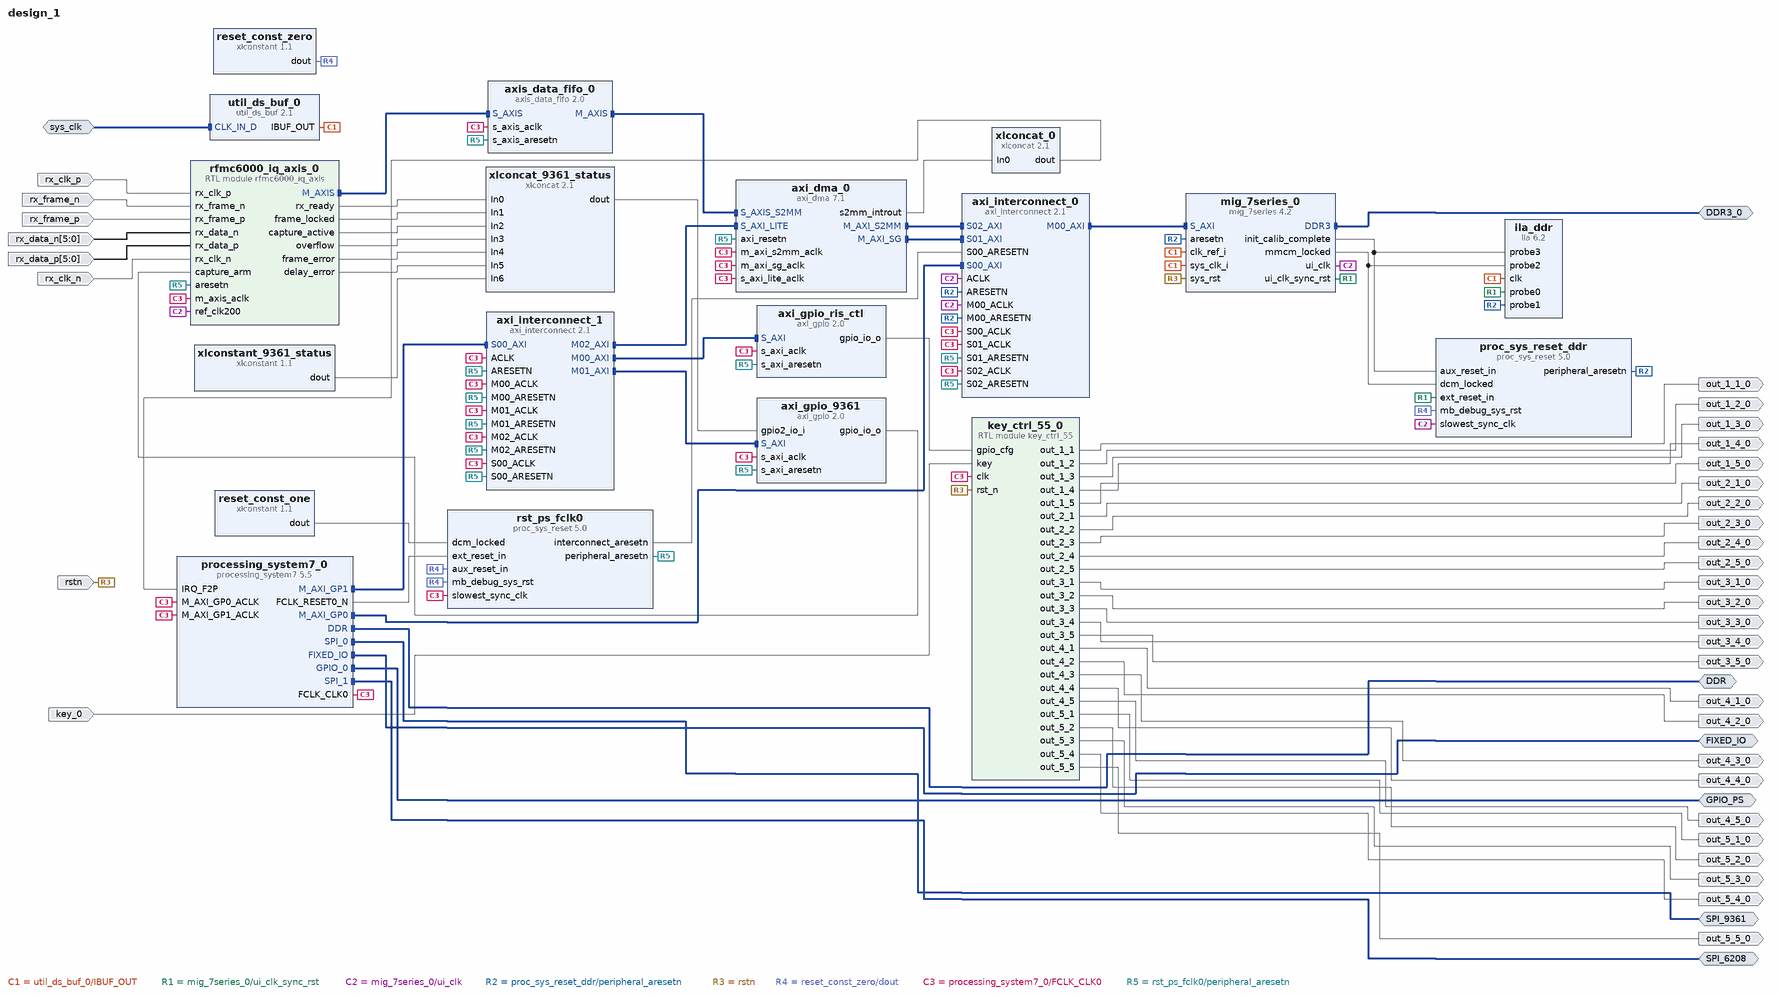
[diagram p0: block diagram of the top level]
# Vivado block design design_1, xc7z035ffg900-2, Vivado 2020.2
create_bd_design design_1

create_bd_intf_port -mode Master -vlnv xilinx.com:interface:ddrx_rtl:1.0 DDR
create_bd_intf_port -mode Master -vlnv xilinx.com:display_processing_system7:fixedio_rtl:1.0 FIXED_IO
create_bd_intf_port -mode Master -vlnv xilinx.com:interface:ddrx_rtl:1.0 DDR3_0
create_bd_intf_port -mode Slave -vlnv xilinx.com:interface:diff_clock_rtl:1.0 sys_clk
create_bd_intf_port -mode Master -vlnv xilinx.com:interface:spi_rtl:1.0 SPI_9361
create_bd_intf_port -mode Master -vlnv xilinx.com:interface:gpio_rtl:1.0 GPIO_PS
create_bd_intf_port -mode Master -vlnv xilinx.com:interface:spi_rtl:1.0 SPI_6208
create_bd_port -dir I -type rst rstn
create_bd_port -dir I key_0
create_bd_port -dir O out_1_1_0
create_bd_port -dir O out_1_2_0
create_bd_port -dir O out_1_3_0
create_bd_port -dir O out_1_4_0
create_bd_port -dir O out_1_5_0
create_bd_port -dir O out_2_1_0
create_bd_port -dir O out_2_2_0
create_bd_port -dir O out_2_3_0
create_bd_port -dir O out_2_4_0
create_bd_port -dir O out_2_5_0
create_bd_port -dir O out_3_1_0
create_bd_port -dir O out_3_2_0
create_bd_port -dir O out_3_3_0
create_bd_port -dir O out_3_4_0
create_bd_port -dir O out_3_5_0
create_bd_port -dir O out_4_1_0
create_bd_port -dir O out_4_2_0
create_bd_port -dir O out_4_3_0
create_bd_port -dir O out_4_4_0
create_bd_port -dir O out_4_5_0
create_bd_port -dir O out_5_1_0
create_bd_port -dir O out_5_2_0
create_bd_port -dir O out_5_3_0
create_bd_port -dir O out_5_4_0
create_bd_port -dir O out_5_5_0
create_bd_port -dir I -type clk rx_clk_p
create_bd_port -dir I rx_frame_n
create_bd_port -dir I rx_frame_p
create_bd_port -dir I -from 5 -to 0 rx_data_n
create_bd_port -dir I -from 5 -to 0 rx_data_p
create_bd_port -dir I -type clk rx_clk_n

create_bd_cell -type ip -vlnv xilinx.com:ip:processing_system7:5.5 processing_system7_0
set_property -dict [list \
  CONFIG.PCW_ENET0_ENET0_IO {MIO 16 .. 27} \
  CONFIG.PCW_ENET0_GRP_MDIO_ENABLE 1 \
  CONFIG.PCW_ENET0_GRP_MDIO_IO {MIO 52 .. 53} \
  CONFIG.PCW_ENET0_PERIPHERAL_ENABLE 1 \
  CONFIG.PCW_ENET0_RESET_ENABLE 1 \
  CONFIG.PCW_ENET0_RESET_IO {MIO 28} \
  CONFIG.PCW_ENET_RESET_ENABLE 1 \
  CONFIG.PCW_ENET_RESET_SELECT {Share reset pin} \
  CONFIG.PCW_FPGA0_PERIPHERAL_FREQMHZ 100 \
  CONFIG.PCW_GPIO_EMIO_GPIO_ENABLE 1 \
  CONFIG.PCW_GPIO_EMIO_GPIO_IO 1 \
  CONFIG.PCW_GPIO_EMIO_GPIO_WIDTH 1 \
  CONFIG.PCW_GPIO_MIO_GPIO_ENABLE 1 \
  CONFIG.PCW_GPIO_MIO_GPIO_IO MIO \
  CONFIG.PCW_I2C_RESET_ENABLE 1 \
  CONFIG.PCW_IRQ_F2P_INTR 1 \
  CONFIG.PCW_PRESET_BANK1_VOLTAGE {LVCMOS 1.8V} \
  CONFIG.PCW_QSPI_PERIPHERAL_ENABLE 0 \
  CONFIG.PCW_SD0_PERIPHERAL_ENABLE 0 \
  CONFIG.PCW_SPI0_PERIPHERAL_ENABLE 1 \
  CONFIG.PCW_SPI0_SPI0_IO EMIO \
  CONFIG.PCW_SPI1_PERIPHERAL_ENABLE 1 \
  CONFIG.PCW_SPI1_SPI1_IO EMIO \
  CONFIG.PCW_UART0_PERIPHERAL_ENABLE 1 \
  CONFIG.PCW_UART0_UART0_IO {MIO 46 .. 47} \
  CONFIG.PCW_UART1_PERIPHERAL_ENABLE 0 \
  CONFIG.PCW_UART_PERIPHERAL_FREQMHZ 100 \
  CONFIG.PCW_UIPARAM_DDR_MEMORY_TYPE {DDR 3 (Low Voltage)} \
  CONFIG.PCW_UIPARAM_DDR_PARTNO {MT41K256M16 RE-125} \
  CONFIG.PCW_USB_RESET_ENABLE 1 \
  CONFIG.PCW_USE_FABRIC_INTERRUPT 1 \
  CONFIG.PCW_USE_M_AXI_GP1 1 \
] [get_bd_cells processing_system7_0]
# 223 more settings of processing_system7_0 are not shown: defaults, MIO pin electricals, DDR timing, and values the tool derives
create_bd_cell -type ip -vlnv xilinx.com:ip:mig_7series:4.2 mig_7series_0
set_property -dict [list \
  CONFIG.BOARD_MIG_PARAM Custom \
  CONFIG.RESET_BOARD_INTERFACE Custom \
  CONFIG.XML_INPUT_FILE mig_a.prj \
] [get_bd_cells mig_7series_0]
create_bd_cell -type ip -vlnv xilinx.com:ip:util_ds_buf:2.1 util_ds_buf_0
set_property -dict {CONFIG.C_BUF_TYPE IBUFDS} [get_bd_cells util_ds_buf_0]
create_bd_cell -type ip -vlnv xilinx.com:ip:proc_sys_reset:5.0 proc_sys_reset_ddr
set_property -dict {CONFIG.C_AUX_RESET_HIGH 0} [get_bd_cells proc_sys_reset_ddr]
create_bd_cell -type ip -vlnv xilinx.com:ip:axi_interconnect:2.1 axi_interconnect_0
set_property -dict {CONFIG.NUM_MI 1 CONFIG.NUM_SI 3} [get_bd_cells axi_interconnect_0]
create_bd_cell -type ip -vlnv xilinx.com:ip:proc_sys_reset:5.0 rst_ps_fclk0
set_property -dict {CONFIG.C_AUX_RESET_HIGH 1} [get_bd_cells rst_ps_fclk0]
create_bd_cell -type ip -vlnv xilinx.com:ip:xlconstant:1.1 reset_const_zero
set_property -dict {CONFIG.CONST_VAL 0 CONFIG.CONST_WIDTH 1} [get_bd_cells reset_const_zero]
create_bd_cell -type ip -vlnv xilinx.com:ip:xlconstant:1.1 reset_const_one
set_property -dict {CONFIG.CONST_VAL 1 CONFIG.CONST_WIDTH 1} [get_bd_cells reset_const_one]
create_bd_cell -type ip -vlnv xilinx.com:ip:ila:6.2 ila_ddr
set_property -dict [list \
  CONFIG.C_ENABLE_ILA_AXI_MON false \
  CONFIG.C_INPUT_PIPE_STAGES 2 \
  CONFIG.C_MONITOR_TYPE Native \
  CONFIG.C_NUM_OF_PROBES 4 \
] [get_bd_cells ila_ddr]
create_bd_cell -type ip -vlnv xilinx.com:ip:axi_gpio:2.0 axi_gpio_ris_ctl
set_property -dict {CONFIG.C_ALL_OUTPUTS 1 CONFIG.C_GPIO_WIDTH 32} [get_bd_cells axi_gpio_ris_ctl]
create_bd_cell -type ip -vlnv xilinx.com:ip:axi_interconnect:2.1 axi_interconnect_1
set_property -dict {CONFIG.NUM_MI 3} [get_bd_cells axi_interconnect_1]
create_bd_cell -type module -reference key_ctrl_55 key_ctrl_55_0
create_bd_cell -type ip -vlnv xilinx.com:ip:axi_gpio:2.0 axi_gpio_9361
set_property -dict [list \
  CONFIG.C_ALL_INPUTS_2 1 \
  CONFIG.C_ALL_OUTPUTS 1 \
  CONFIG.C_GPIO_WIDTH 1 \
  CONFIG.C_IS_DUAL 1 \
] [get_bd_cells axi_gpio_9361]
create_bd_cell -type ip -vlnv xilinx.com:ip:axis_data_fifo:2.0 axis_data_fifo_0
create_bd_cell -type ip -vlnv xilinx.com:ip:axi_dma:7.1 axi_dma_0
set_property -dict [list \
  CONFIG.c_include_mm2s 0 \
  CONFIG.c_sg_include_stscntrl_strm 0 \
  CONFIG.c_sg_length_width 23 \
] [get_bd_cells axi_dma_0]
create_bd_cell -type ip -vlnv xilinx.com:ip:xlconcat:2.1 xlconcat_0
set_property -dict {CONFIG.NUM_PORTS 1} [get_bd_cells xlconcat_0]
create_bd_cell -type ip -vlnv xilinx.com:ip:xlconcat:2.1 xlconcat_9361_status
set_property -dict {CONFIG.IN6_WIDTH 26 CONFIG.NUM_PORTS 7} [get_bd_cells xlconcat_9361_status]
create_bd_cell -type ip -vlnv xilinx.com:ip:xlconstant:1.1 xlconstant_9361_status
set_property -dict {CONFIG.CONST_VAL 0 CONFIG.CONST_WIDTH 26} [get_bd_cells xlconstant_9361_status]
create_bd_cell -type module -reference rfmc6000_iq_axis rfmc6000_iq_axis_0

# ---- connections ----

connect_bd_intf_net -intf_net CLK_IN_D_0_1 [get_bd_intf_ports sys_clk] [get_bd_intf_pins util_ds_buf_0/CLK_IN_D]
connect_bd_intf_net [get_bd_intf_pins axi_interconnect_1/M00_AXI] [get_bd_intf_pins axi_gpio_ris_ctl/S_AXI]
connect_bd_intf_net [get_bd_intf_pins processing_system7_0/M_AXI_GP0] [get_bd_intf_pins axi_interconnect_0/S00_AXI]
connect_bd_intf_net [get_bd_intf_ports DDR] [get_bd_intf_pins processing_system7_0/DDR]
connect_bd_intf_net [get_bd_intf_ports DDR3_0] [get_bd_intf_pins mig_7series_0/DDR3]
connect_bd_intf_net [get_bd_intf_pins processing_system7_0/M_AXI_GP1] [get_bd_intf_pins axi_interconnect_1/S00_AXI]
connect_bd_intf_net [get_bd_intf_pins axi_interconnect_0/M00_AXI] [get_bd_intf_pins mig_7series_0/S_AXI]
connect_bd_intf_net [get_bd_intf_ports SPI_9361] [get_bd_intf_pins processing_system7_0/SPI_0]
connect_bd_intf_net [get_bd_intf_ports FIXED_IO] [get_bd_intf_pins processing_system7_0/FIXED_IO]
connect_bd_intf_net [get_bd_intf_ports GPIO_PS] [get_bd_intf_pins processing_system7_0/GPIO_0]
connect_bd_intf_net [get_bd_intf_pins rfmc6000_iq_axis_0/M_AXIS] [get_bd_intf_pins axis_data_fifo_0/S_AXIS]
connect_bd_intf_net [get_bd_intf_pins axi_gpio_9361/S_AXI] [get_bd_intf_pins axi_interconnect_1/M01_AXI]
connect_bd_intf_net [get_bd_intf_pins axi_interconnect_1/M02_AXI] [get_bd_intf_pins axi_dma_0/S_AXI_LITE]
connect_bd_intf_net [get_bd_intf_pins axis_data_fifo_0/M_AXIS] [get_bd_intf_pins axi_dma_0/S_AXIS_S2MM]
connect_bd_intf_net [get_bd_intf_pins axi_dma_0/M_AXI_S2MM] [get_bd_intf_pins axi_interconnect_0/S02_AXI]
connect_bd_intf_net [get_bd_intf_pins axi_dma_0/M_AXI_SG] [get_bd_intf_pins axi_interconnect_0/S01_AXI]
connect_bd_intf_net [get_bd_intf_ports SPI_6208] [get_bd_intf_pins processing_system7_0/SPI_1]
connect_bd_net [get_bd_pins util_ds_buf_0/IBUF_OUT] \
  [get_bd_pins mig_7series_0/sys_clk_i] [get_bd_pins mig_7series_0/clk_ref_i] [get_bd_pins ila_ddr/clk]
connect_bd_net [get_bd_pins mig_7series_0/init_calib_complete] [get_bd_pins proc_sys_reset_ddr/aux_reset_in] [get_bd_pins ila_ddr/probe3]
connect_bd_net [get_bd_pins mig_7series_0/ui_clk_sync_rst] [get_bd_pins proc_sys_reset_ddr/ext_reset_in] [get_bd_pins ila_ddr/probe0]
connect_bd_net [get_bd_pins mig_7series_0/ui_clk] \
  [get_bd_pins proc_sys_reset_ddr/slowest_sync_clk] [get_bd_pins axi_interconnect_0/ACLK] \
  [get_bd_pins axi_interconnect_0/M00_ACLK] [get_bd_pins rfmc6000_iq_axis_0/ref_clk200]
connect_bd_net -net proc_sys_reset_0_peripheral_aresetn [get_bd_pins proc_sys_reset_ddr/peripheral_aresetn] \
  [get_bd_pins mig_7series_0/aresetn] [get_bd_pins axi_interconnect_0/ARESETN] [get_bd_pins axi_interconnect_0/M00_ARESETN] \
  [get_bd_pins ila_ddr/probe1]
connect_bd_net -net sys_rst_0_1 [get_bd_ports rstn] [get_bd_pins mig_7series_0/sys_rst] [get_bd_pins key_ctrl_55_0/rst_n]
connect_bd_net [get_bd_pins processing_system7_0/FCLK_RESET0_N] [get_bd_pins rst_ps_fclk0/ext_reset_in]
connect_bd_net [get_bd_pins reset_const_zero/dout] \
  [get_bd_pins rst_ps_fclk0/aux_reset_in] [get_bd_pins rst_ps_fclk0/mb_debug_sys_rst] \
  [get_bd_pins proc_sys_reset_ddr/mb_debug_sys_rst]
connect_bd_net [get_bd_pins reset_const_one/dout] [get_bd_pins rst_ps_fclk0/dcm_locked]
connect_bd_net [get_bd_pins rst_ps_fclk0/interconnect_aresetn] [get_bd_pins axi_interconnect_0/S00_ARESETN]
connect_bd_net [get_bd_pins mig_7series_0/mmcm_locked] [get_bd_pins proc_sys_reset_ddr/dcm_locked] [get_bd_pins ila_ddr/probe2]
connect_bd_net [get_bd_pins processing_system7_0/FCLK_CLK0] \
  [get_bd_pins processing_system7_0/M_AXI_GP0_ACLK] [get_bd_pins axi_interconnect_0/S00_ACLK] \
  [get_bd_pins rst_ps_fclk0/slowest_sync_clk] [get_bd_pins axi_gpio_ris_ctl/s_axi_aclk] \
  [get_bd_pins axi_interconnect_1/M00_ACLK] [get_bd_pins axi_interconnect_1/ACLK] [get_bd_pins axi_interconnect_1/S00_ACLK] \
  [get_bd_pins processing_system7_0/M_AXI_GP1_ACLK] [get_bd_pins key_ctrl_55_0/clk] [get_bd_pins axi_interconnect_1/M01_ACLK] \
  [get_bd_pins axi_gpio_9361/s_axi_aclk] [get_bd_pins axis_data_fifo_0/s_axis_aclk] [get_bd_pins axi_interconnect_1/M02_ACLK] \
  [get_bd_pins axi_dma_0/s_axi_lite_aclk] [get_bd_pins axi_dma_0/m_axi_sg_aclk] [get_bd_pins axi_dma_0/m_axi_s2mm_aclk] \
  [get_bd_pins axi_interconnect_0/S01_ACLK] [get_bd_pins axi_interconnect_0/S02_ACLK] \
  [get_bd_pins rfmc6000_iq_axis_0/m_axis_aclk]
connect_bd_net -net key_0_1 [get_bd_ports key_0] [get_bd_pins key_ctrl_55_0/key]
connect_bd_net [get_bd_pins key_ctrl_55_0/out_1_1] [get_bd_ports out_1_1_0]
connect_bd_net [get_bd_pins key_ctrl_55_0/out_1_2] [get_bd_ports out_1_2_0]
connect_bd_net [get_bd_pins key_ctrl_55_0/out_1_3] [get_bd_ports out_1_3_0]
connect_bd_net [get_bd_pins key_ctrl_55_0/out_1_4] [get_bd_ports out_1_4_0]
connect_bd_net [get_bd_pins key_ctrl_55_0/out_1_5] [get_bd_ports out_1_5_0]
connect_bd_net [get_bd_pins key_ctrl_55_0/out_2_1] [get_bd_ports out_2_1_0]
connect_bd_net [get_bd_pins key_ctrl_55_0/out_2_2] [get_bd_ports out_2_2_0]
connect_bd_net [get_bd_pins key_ctrl_55_0/out_2_3] [get_bd_ports out_2_3_0]
connect_bd_net [get_bd_pins key_ctrl_55_0/out_2_4] [get_bd_ports out_2_4_0]
connect_bd_net [get_bd_pins key_ctrl_55_0/out_2_5] [get_bd_ports out_2_5_0]
connect_bd_net [get_bd_pins key_ctrl_55_0/out_3_1] [get_bd_ports out_3_1_0]
connect_bd_net [get_bd_pins key_ctrl_55_0/out_3_2] [get_bd_ports out_3_2_0]
connect_bd_net [get_bd_pins key_ctrl_55_0/out_3_3] [get_bd_ports out_3_3_0]
connect_bd_net [get_bd_pins key_ctrl_55_0/out_3_4] [get_bd_ports out_3_4_0]
connect_bd_net [get_bd_pins key_ctrl_55_0/out_3_5] [get_bd_ports out_3_5_0]
connect_bd_net [get_bd_pins key_ctrl_55_0/out_4_1] [get_bd_ports out_4_1_0]
connect_bd_net [get_bd_pins key_ctrl_55_0/out_4_2] [get_bd_ports out_4_2_0]
connect_bd_net [get_bd_pins key_ctrl_55_0/out_4_3] [get_bd_ports out_4_3_0]
connect_bd_net [get_bd_pins key_ctrl_55_0/out_4_4] [get_bd_ports out_4_4_0]
connect_bd_net [get_bd_pins key_ctrl_55_0/out_4_5] [get_bd_ports out_4_5_0]
connect_bd_net [get_bd_pins key_ctrl_55_0/out_5_1] [get_bd_ports out_5_1_0]
connect_bd_net [get_bd_pins key_ctrl_55_0/out_5_2] [get_bd_ports out_5_2_0]
connect_bd_net [get_bd_pins key_ctrl_55_0/out_5_3] [get_bd_ports out_5_3_0]
connect_bd_net [get_bd_pins key_ctrl_55_0/out_5_4] [get_bd_ports out_5_4_0]
connect_bd_net [get_bd_pins key_ctrl_55_0/out_5_5] [get_bd_ports out_5_5_0]
connect_bd_net [get_bd_pins rst_ps_fclk0/peripheral_aresetn] \
  [get_bd_pins axi_gpio_ris_ctl/s_axi_aresetn] [get_bd_pins axi_interconnect_1/M00_ARESETN] \
  [get_bd_pins axi_interconnect_1/ARESETN] [get_bd_pins axi_interconnect_1/S00_ARESETN] \
  [get_bd_pins axi_gpio_9361/s_axi_aresetn] [get_bd_pins axi_interconnect_1/M01_ARESETN] \
  [get_bd_pins axis_data_fifo_0/s_axis_aresetn] [get_bd_pins axi_interconnect_1/M02_ARESETN] \
  [get_bd_pins axi_dma_0/axi_resetn] [get_bd_pins axi_interconnect_0/S02_ARESETN] \
  [get_bd_pins axi_interconnect_0/S01_ARESETN] [get_bd_pins rfmc6000_iq_axis_0/aresetn]
connect_bd_net [get_bd_pins axi_gpio_ris_ctl/gpio_io_o] [get_bd_pins key_ctrl_55_0/gpio_cfg]
connect_bd_net -net rx_clk_p_0_1 [get_bd_ports rx_clk_p] [get_bd_pins rfmc6000_iq_axis_0/rx_clk_p]
connect_bd_net -net rx_frame_n_0_1 [get_bd_ports rx_frame_n] [get_bd_pins rfmc6000_iq_axis_0/rx_frame_n]
connect_bd_net -net rx_frame_p_0_1 [get_bd_ports rx_frame_p] [get_bd_pins rfmc6000_iq_axis_0/rx_frame_p]
connect_bd_net -net rx_data_n_0_1 [get_bd_ports rx_data_n] [get_bd_pins rfmc6000_iq_axis_0/rx_data_n]
connect_bd_net -net rx_data_p_0_1 [get_bd_ports rx_data_p] [get_bd_pins rfmc6000_iq_axis_0/rx_data_p]
connect_bd_net -net rx_clk_n_0_1 [get_bd_ports rx_clk_n] [get_bd_pins rfmc6000_iq_axis_0/rx_clk_n]
connect_bd_net [get_bd_pins axi_gpio_9361/gpio_io_o] [get_bd_pins rfmc6000_iq_axis_0/capture_arm]
connect_bd_net [get_bd_pins xlconcat_0/dout] [get_bd_pins processing_system7_0/IRQ_F2P]
connect_bd_net [get_bd_pins axi_dma_0/s2mm_introut] [get_bd_pins xlconcat_0/In0]
connect_bd_net [get_bd_pins rfmc6000_iq_axis_0/rx_ready] [get_bd_pins xlconcat_9361_status/In0]
connect_bd_net [get_bd_pins rfmc6000_iq_axis_0/frame_locked] [get_bd_pins xlconcat_9361_status/In1]
connect_bd_net [get_bd_pins rfmc6000_iq_axis_0/capture_active] [get_bd_pins xlconcat_9361_status/In2]
connect_bd_net [get_bd_pins rfmc6000_iq_axis_0/overflow] [get_bd_pins xlconcat_9361_status/In3]
connect_bd_net [get_bd_pins rfmc6000_iq_axis_0/frame_error] [get_bd_pins xlconcat_9361_status/In4]
connect_bd_net [get_bd_pins rfmc6000_iq_axis_0/delay_error] [get_bd_pins xlconcat_9361_status/In5]
connect_bd_net -net xlconstant_0_dout [get_bd_pins xlconstant_9361_status/dout] [get_bd_pins xlconcat_9361_status/In6]
connect_bd_net [get_bd_pins xlconcat_9361_status/dout] [get_bd_pins axi_gpio_9361/gpio2_io_i]

# ---- address map ----
assign_bd_address -offset 0x40000000 -range 1G -target_address_space [get_bd_addr_spaces axi_dma_0/Data_S2MM] [get_bd_addr_segs mig_7series_0/memmap/memaddr]
assign_bd_address -offset 0x40000000 -range 1G -target_address_space [get_bd_addr_spaces axi_dma_0/Data_SG] [get_bd_addr_segs mig_7series_0/memmap/memaddr]
assign_bd_address -offset 0x40000000 -range 1G -target_address_space [get_bd_addr_spaces processing_system7_0/Data] [get_bd_addr_segs mig_7series_0/memmap/memaddr]
assign_bd_address -offset 0x80010000 -range 128 -target_address_space [get_bd_addr_spaces processing_system7_0/Data] [get_bd_addr_segs axi_gpio_ris_ctl/S_AXI/Reg]
assign_bd_address -offset 0x80020000 -range 128 -target_address_space [get_bd_addr_spaces processing_system7_0/Data] [get_bd_addr_segs axi_gpio_9361/S_AXI/Reg]
assign_bd_address -offset 0x81000000 -range 64K -target_address_space [get_bd_addr_spaces processing_system7_0/Data] [get_bd_addr_segs axi_dma_0/S_AXI_LITE/Reg]

validate_bd_design
save_bd_design
